# EasyEDA Pro project rp2040 control board.eprj, board PCB1
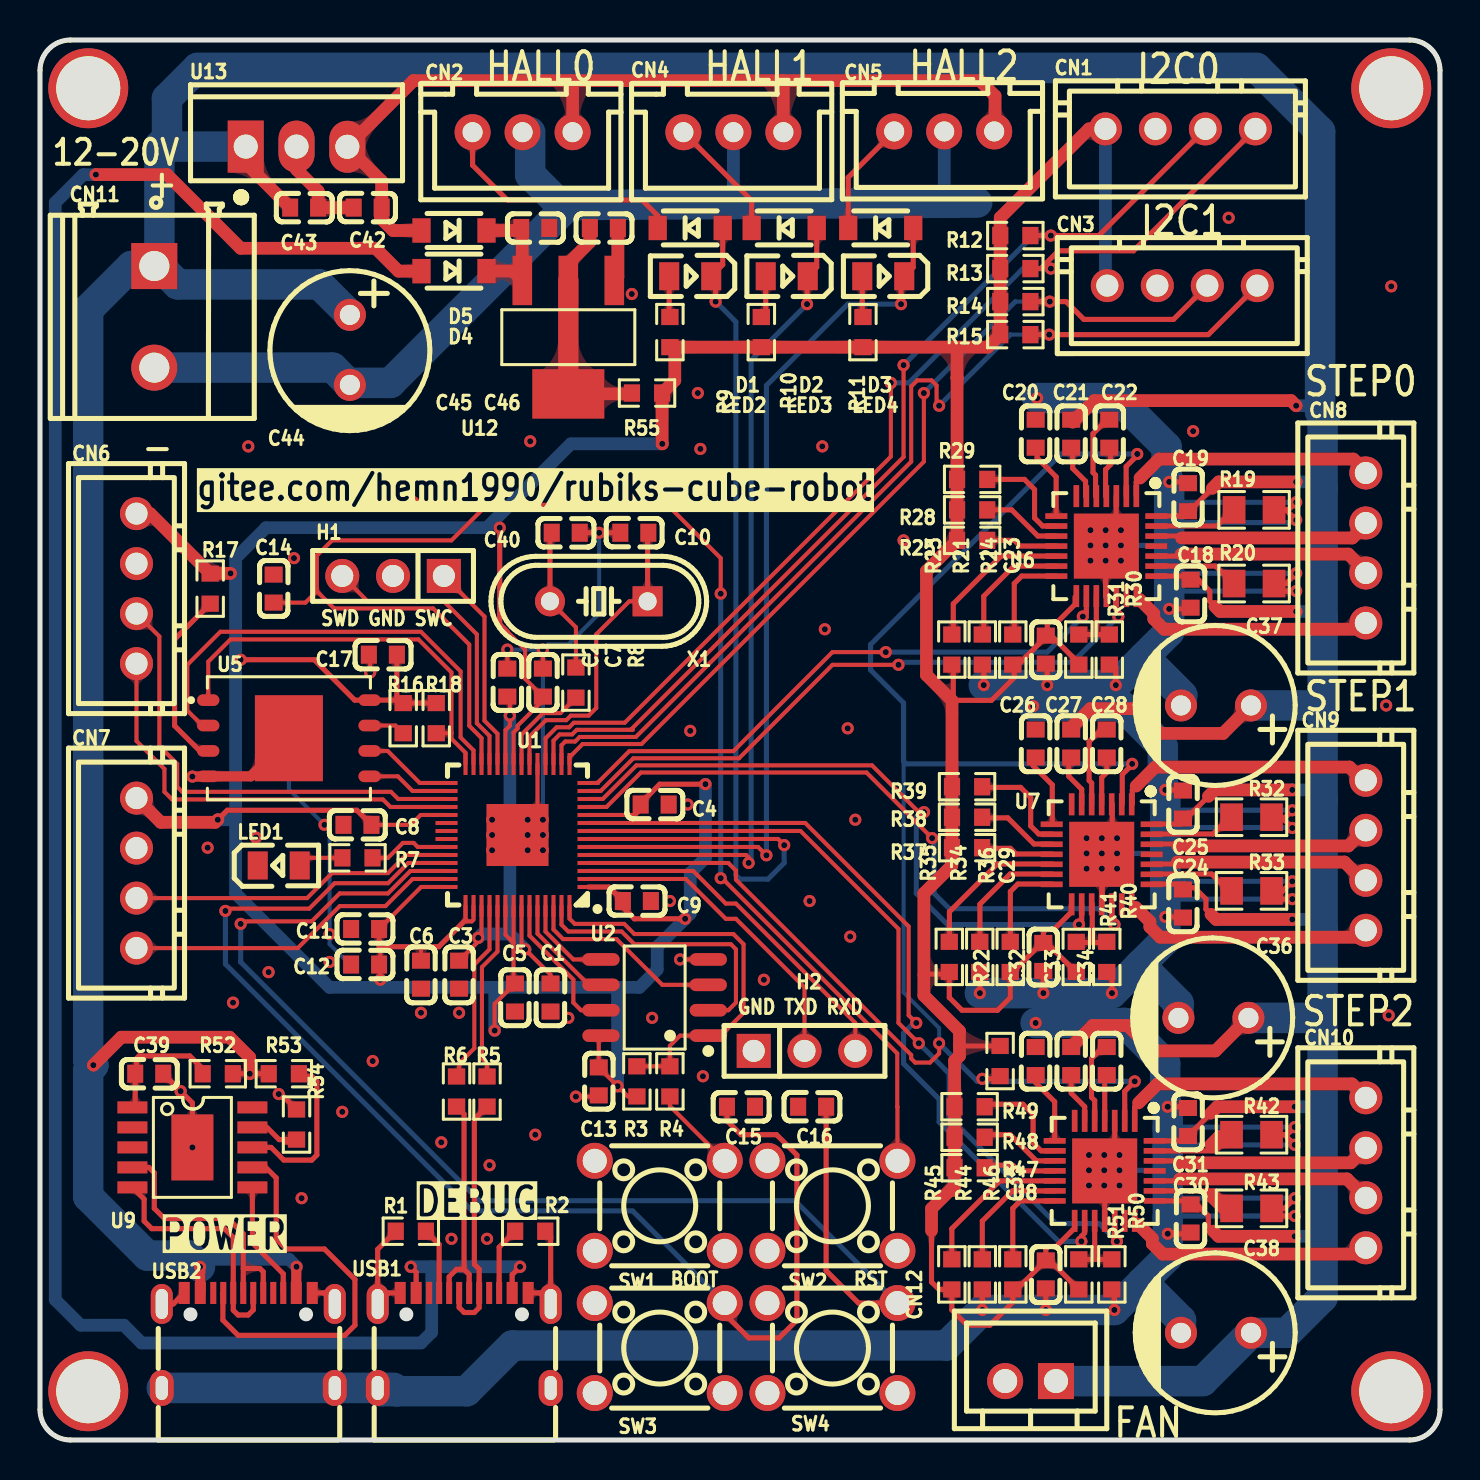
[diagram p1: board, top side]
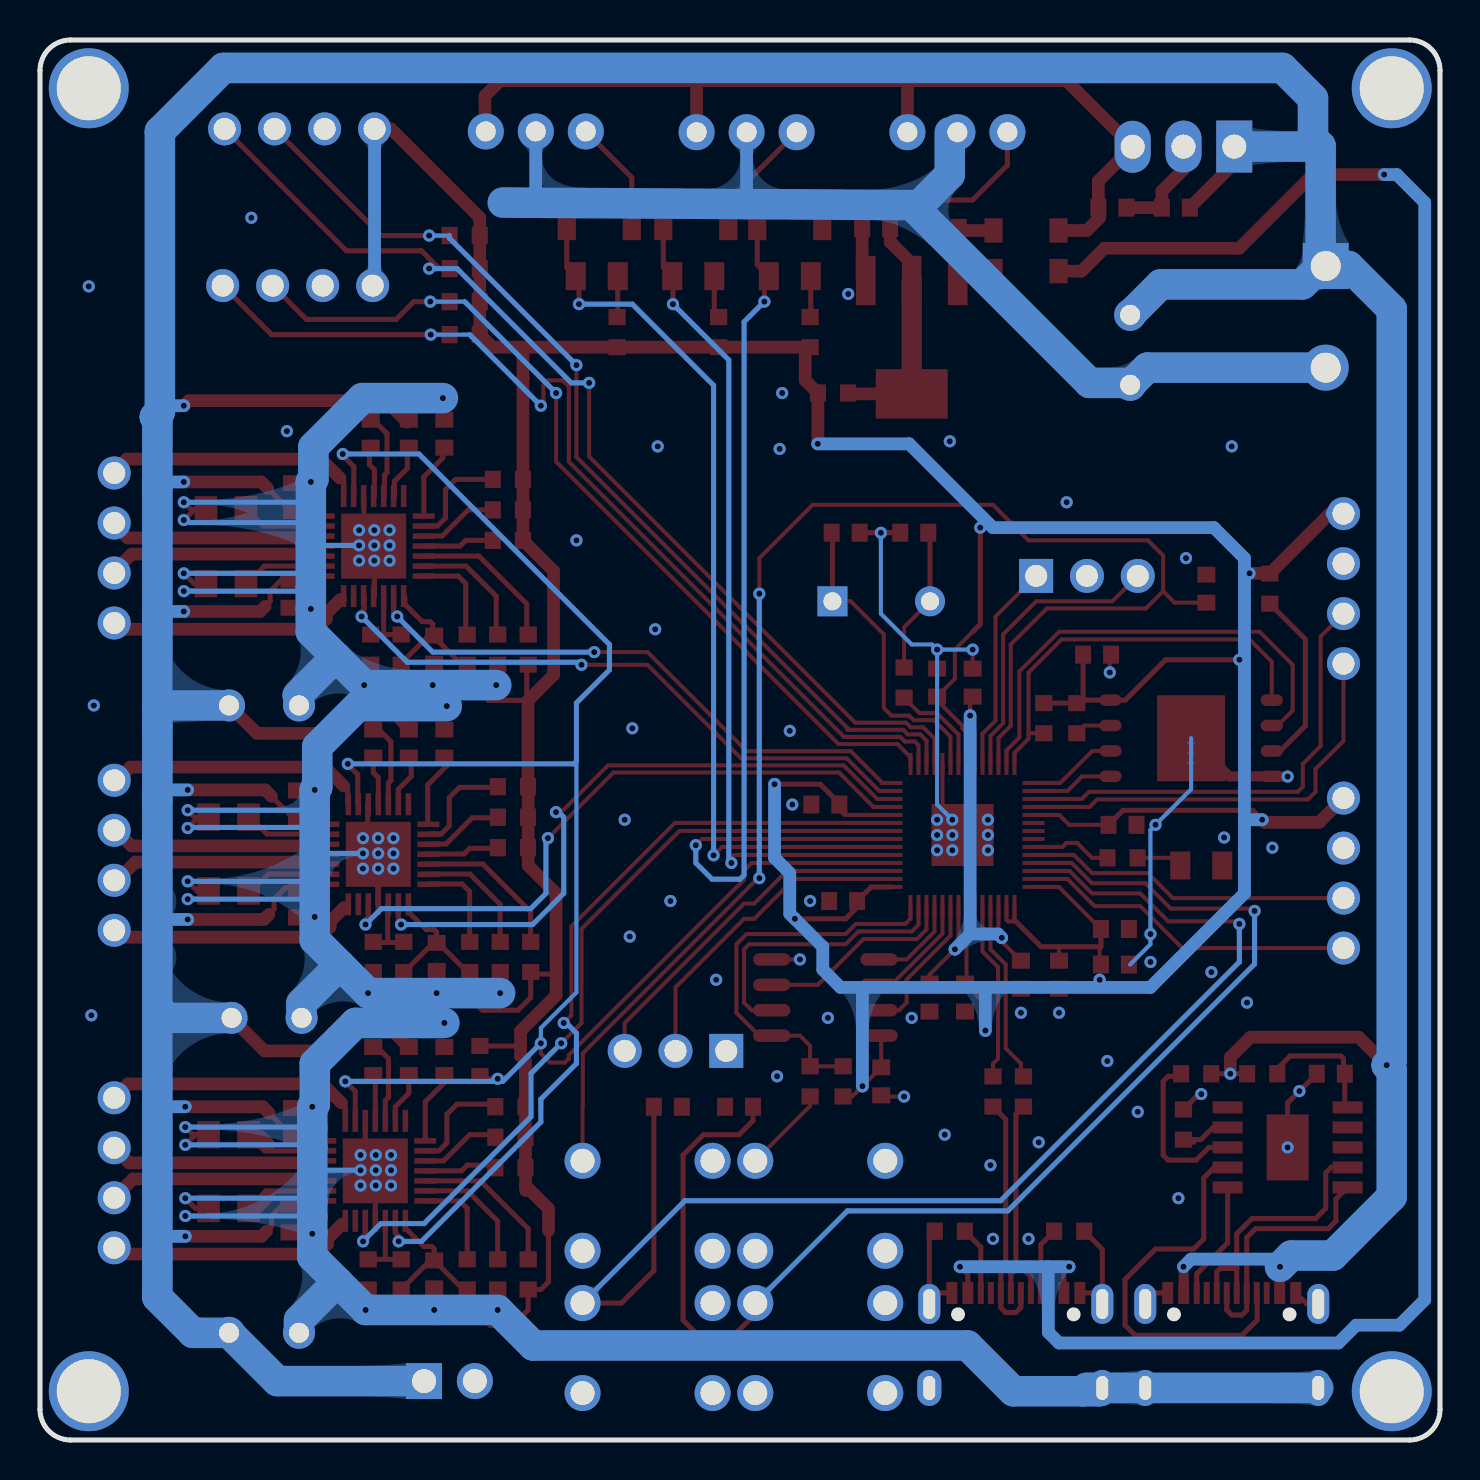
[diagram p2: board, bottom side, seen from below]

Outline 70 x 70 mm; copper layers: Top Layer, Bottom Layer. Coordinates in mm from the lower left corner of the outline.
Outline path: 0,68.48 0,1.52 arc(0.45,0.45) 1.52,0 68.48,0 arc(69.56,0.45) 70,1.52 70,68.48 arc(69.56,69.56) 68.48,70 1.52,70 arc(0.45,69.56) 0,68.48
Stack: Top Layer 0.035mm / Dielectric1 1.51mm FR4 er 4.5 / Bottom Layer 0.035mm

## Design rules (mm)
template: 自定义配置
spacing copperThickness1oz (default): track to track 0.152, other pairs 0.152 to 0.3
spacing copperThickness2oz: track to track 0.203, other pairs 0.152 to 0.3
track width copperThickness1oz (default): min 0.127, default 0.254, max 2.54
track width copperThickness2oz: min 0.203, default 0.254, max 2.54
differential pair differentialPair (default): width min 0.127, default 0.254, max 2.54; gap min 0.152, default 0.152
via viaSize (default): diameter min 0.5, default 0.61, max 10; hole min 0.3, default 0.305, max 6.299

## Placement (name value [footprint] x y rotation side)
C1  100nF  [C0603]  25.53 22.12 90 top
C2  100nF  [C0603]  23.37 37.87 270 top
C3  1uF  [C0603]  20.96 23.27 90 top
C4  100nF  [C0603]  30.73 31.78 180 top
C5  100nF  [C0603]  23.75 22.12 90 top
C6  100nF  [C0603]  19.05 23.27 90 top
C7  100nF  [C0603]  25.15 37.87 270 top
C8  100nF  [C0603]  15.88 30.76 0 top
C9  100nF  [C0603]  29.84 26.95 180 top
C10  27pF  [C0603]  29.72 45.36 0 top
C11  100nF  [C0603]  16.26 25.55 0 top
C12  1uF  [C0603]  16.26 23.77 0 top
C13  100nF  [C0603]  27.94 17.93 270 top
C14  100nF  [C0603]  11.68 42.57 270 top
C15  100nF  [C0603]  35.05 16.66 180 top
C16  100nF  [C0603]  38.61 16.66 0 top
C17  100nF  [C0603]  17.14 39.27 180 top
C18  100nF  [C0603]  57.53 42.32 90 top
C19  100nF  [C0603]  57.4 47.14 270 top
C20  220nF  [C0603]  49.78 50.32 90 top
C21  100nF  [C0603]  51.56 50.32 90 top
C22  100nF  [C0603]  53.47 50.32 90 top
C23  100nF  [C0603]  50.29 39.52 90 top
C24  100nF  [C0603]  57.15 26.82 90 top
C25  100nF  [C0603]  57.15 31.78 270 top
C26  220nF  [C0603]  49.78 34.82 90 top
C27  100nF  [C0603]  51.56 34.82 90 top
C28  100nF  [C0603]  53.34 34.82 90 top
C29  100nF  [C0603]  50.16 24.16 90 top
C30  100nF  [C0603]  57.53 11.07 90 top
C31  100nF  [C0603]  57.4 15.9 270 top
C32  220nF  [C0603]  49.78 18.95 90 top
C33  100nF  [C0603]  51.56 18.95 90 top
C34  100nF  [C0603]  53.34 18.95 90 top
C35  100nF  [C0603]  50.29 8.28 90 top
C36  330uF  [CAP-TH_BD8.0-P3.50-D0.6-FD]  58.67 21.11 180 top
C37  330uF  [CAP-TH_BD8.0-P3.50-D0.6-FD]  58.8 36.73 180 top
C38  330uF  [CAP-TH_BD8.0-P3.50-D0.6-FD]  58.8 5.36 180 top
C39  1uF  [C0603]  5.46 18.31 180 top
C40  27pF  [C0603]  26.29 45.36 180 top
C42  100nF  [C0603]  16.38 61.62 0 top
C43  100nF  [C0603]  13.21 61.62 180 top
C44  330uF  [CAP-TH_BD8.0-P3.50-D0.6-FD]  15.49 54.51 270 top
C45  10uF  [C0603]  24.76 60.6 180 top
C46  10uF  [C0603]  28.19 60.6 180 top
CN1  XH-4A  [CONN-TH_XH2.50-4P]  57.02 65.56 0 top
CN2  XH-3A  [CONN-TH_XH-3A]  24.13 65.39 180 top
CN3  XH-4A  [CONN-TH_XH2.50-4P]  57.12 57.72 0 top
CN4  XH-3A  [CONN-TH_XH-3A]  34.67 65.39 180 top
CN5  XH-3A  [CONN-TH_XH-3A]  45.21 65.43 180 top
CN6  XH-4A  [CONN-TH_XH2.50-4P]  4.83 42.57 270 top
CN7  XH-4A  [CONN-TH_XH2.50-4P]  4.83 28.35 270 top
CN8  XH-4A  [CONN-TH_XH2.50-4P]  66.29 44.6 270 top
CN9  XH-4A  [CONN-TH_XH2.50-4P]  66.29 29.24 270 top
CN10  XH-4A  [CONN-TH_XH2.50-4P]  66.29 13.36 270 top
CN11  DB128V-5.08-2P-GN-S  [CONN-TH_2P-P5.08_DIBO_DB128V-5.08]  5.72 56.16 270 top
CN12  A2501WV-2P  [CONN-TH_A2501WV-2P]  49.53 2.95 180 top
D1  1N5819W  [SOD-123_L2.7-W1.6-LS3.7-R-RD]  32.51 60.6 0 top
D2  1N5819W  [SOD-123_L2.7-W1.6-LS3.7-R-RD]  37.21 60.6 0 top
D3  1N5819W  [SOD-123_L2.7-W1.6-LS3.7-R-RD]  42.04 60.6 0 top
D4  1N5819W  [SOD-123_L2.7-W1.6-LS3.7-R-RD]  20.7 58.45 180 top
D5  1N5819W  [SOD-123_L2.7-W1.6-LS3.7-R-RD]  20.7 60.48 180 top
H1  PZ254V-11-03P  [HDR-TH_3P-P2.54-V-M]  17.65 43.21 180 top
H2  PZ254V-11-03P  [HDR-TH_3P-P2.54-V-M]  38.23 19.46 0 top
LED1  NCD0805R1  [LED0805-R-RD]  11.94 28.73 0 top
LED2  NCD0805R1  [LED0805-R-RD]  32.51 58.19 180 top
LED3  NCD0805R1  [LED0805-R-RD]  37.34 58.19 180 top
LED4  NCD0805R1  [LED0805-R-RD]  42.16 58.19 180 top
NOREF  -  [Pad_e147]  67.56 2.44 0 top
NOREF#2  -  [Pad_e152]  67.56 67.59 0 top
NOREF#3  -  [Pad_e265]  2.41 2.44 0 top
NOREF#4  -  [Pad_e262]  2.41 67.59 0 top
R1  5.1kΩ  [R0603]  18.54 10.44 0 top
R2  5.1kΩ  [R0603]  24.51 10.44 180 top
R3  10kΩ  [R0603]  29.84 17.93 270 top
R4  1k  [R0603]  31.5 17.93 90 top
R5  27Ω  [R0603]  22.35 17.42 270 top
R6  27Ω  [R0603]  20.83 17.42 270 top
R7  1k  [R0603]  15.88 29.11 180 top
R8  1k  [R0603]  26.8 37.87 270 top
R9  1k  [R0603]  31.5 55.4 90 top
R10  1k  [R0603]  36.07 55.4 90 top
R11  1k  [R0603]  41.15 55.4 90 top
R12  5.1kΩ  [R0603]  48.77 60.22 180 top
R13  5.1kΩ  [R0603]  48.77 58.57 180 top
R14  5.1kΩ  [R0603]  48.77 56.92 180 top
R15  5.1kΩ  [R0603]  48.77 55.27 180 top
R16  10kΩ  [R0603]  18.16 36.09 270 top
R17  10kΩ  [R0603]  8.51 42.57 90 top
R18  10kΩ  [R0603]  19.81 36.09 90 top
R19  100mΩ  [R0805]  60.71 46.51 0 top
R20  100mΩ  [R0805]  60.71 42.82 0 top
R21  0Ω  [R0603]  47.12 39.52 90 top
R22  10kΩ  [R0603]  48.01 18.95 270 top
R23  10kΩ  [R0603]  45.59 39.52 270 top
R24  10kΩ  [R0603]  48.64 39.52 270 top
R25  0Ω  [R0603]  46.61 44.98 0 top
R28  0Ω  [R0603]  46.61 46.51 0 top
R29  0Ω  [R0603]  46.61 48.03 0 top
R30  5.1kΩ  [R0603]  53.47 39.52 90 top
R31  8.2kΩ  [R0603]  51.94 39.52 270 top
R32  100mΩ  [R0805]  60.58 31.14 0 top
R33  100mΩ  [R0805]  60.58 27.46 0 top
R34  0Ω  [R0603]  46.99 24.16 90 top
R35  10kΩ  [R0603]  45.47 24.16 270 top
R36  10kΩ  [R0603]  48.51 24.16 270 top
R37  0Ω  [R0603]  46.35 29.62 0 top
R38  0Ω  [R0603]  46.35 31.14 0 top
R39  0Ω  [R0603]  46.35 32.66 0 top
R40  5.1kΩ  [R0603]  53.34 24.16 90 top
R41  8.2kΩ  [R0603]  51.82 24.16 270 top
R42  100mΩ  [R0805]  60.58 15.27 0 top
R43  100mΩ  [R0805]  60.58 11.58 0 top
R44  0Ω  [R0603]  47.12 8.28 90 top
R45  10kΩ  [R0603]  45.59 8.28 270 top
R46  10kΩ  [R0603]  48.64 8.28 270 top
R47  0Ω  [R0603]  46.48 13.61 0 top
R48  0Ω  [R0603]  46.48 15.14 0 top
R49  0Ω  [R0603]  46.48 16.66 0 top
R50  5.1kΩ  [R0603]  53.59 8.28 90 top
R51  8.2kΩ  [R0603]  51.94 8.28 270 top
R52  1k  [R0603]  8.89 18.31 0 top
R53  10kΩ  [R0603]  12.19 18.31 0 top
R54  56kΩ  [R0603]  12.83 15.77 270 top
R55  0Ω  [R0603]  30.35 52.35 0 top
SW1  TS665CJ  [SW-TH_4P-L6.0-W6.0-P4.50-LS6.5]  30.99 11.71 0 top
SW2  TS665CJ  [SW-TH_4P-L6.0-W6.0-P4.50-LS6.5]  39.62 11.71 0 top
SW3  TS665CJ  [SW-TH_4P-L6.0-W6.0-P4.50-LS6.5]  30.99 4.6 0 top
SW4  TS665CJ  [SW-TH_4P-L6.0-W6.0-P4.50-LS6.5]  39.62 4.6 0 top
U1  RP2040  [LQFN-56_L7.0-W7.0-P0.4-EP]  23.88 30.25 180 top
U2  W25Q16JVSNIQ  [SOP-8_L4.9-W3.9-P1.27-LS6.0-BL]  30.73 22.12 90 top
U5  W25N01GVZEIG  [WSON-8_L8.0-W6.10-P1.27-TL-EP]  12.45 35.09 0 top
U6  HR4988E  [QFN-28_L5.0-W5.0-P0.50-BL-EP3.3]  53.32 44.7 180 top
U7  HR4988E  [QFN-28_L5.0-W5.0-P0.50-BL-EP3.3]  53.09 29.29 180 top
U8  HR4988E  [QFN-28_L5.0-W5.0-P0.50-BL-EP3.3]  53.24 13.46 180 top
U9  CH224K  [ESSOP-10_L4.9-W3.9-P1.0-LS6.0-TL-EP]  7.62 14.63 270 top
U12  AMS1117-3.3  [SOT-223-4_L6.5-W3.5-P2.30-LS7.0-BR]  26.42 55.14 90 top
U13  L7805CV-DG  [TO-220-3_L10.0-W4.5-P2.54-L]  12.83 64.67 0 top
USB1  TYPE-C 16PIN 2MD(073)  [USB-C-SMD_TYPE-C-6PIN-2MD-073]  21.21 4.98 0 top
USB2  TYPE-C 16PIN 2MD(073)  [USB-C-SMD_TYPE-C-6PIN-2MD-073]  10.41 4.98 0 top
X1  12MHz  [HC-49US_L11.5-W4.5-P4.88]  27.94 41.94 180 top

## Footprints (pads in the part's own frame, mm; a bottom-side part is the same pattern mirrored in y, then rotated)
C0603
  rect 0.8x0.9 smd: 1(-0.7,0) 2(0.7,0)
CAP-TH_BD8.0-P3.50-D0.6-FD
  round 1.6 hole 1: 1(-1.75,0) 2(1.75,0)
CONN-TH_2P-P5.08_DIBO_DB128V-5.08
  rect 2.3x2.3 hole 1.5: 1(-2.54,0)
  round 2.3 hole 1.5: 2(2.54,0)
CONN-TH_A2501WV-2P
  rect 1.8x1.8 hole 1.2: 1(-1.27,0)
  round 1.8 hole 1.2: 2(1.27,0)
CONN-TH_XH2.50-4P
  round 1.65 hole 1.1: 1(-3.75,0) 2(-1.25,0) 3(1.25,0) 4(3.75,0)
CONN-TH_XH-3A
  round 1.8 hole 1: 1(-2.5,0) 2(0,0) 3(2.5,0)
ESSOP-10_L4.9-W3.9-P1.0-LS6.0-TL-EP
  rect 0.6x1.5 smd: 1(-2,-3) 2(-1,-3) 3(0,-3) 4(1,-3) 5(2,-3) 6(2,3) 7(1,3) 8(0,3) 9(-1,3) 10(-2,3)
  rect 3.3x2.1 smd: 11(0,0)
HC-49US_L11.5-W4.5-P4.88
  rect 1.5x1.5 hole 0.9: 1(-2.44,0)
  round 1.5 hole 0.9: 2(2.44,0)
HDR-TH_3P-P2.54-V-M
  rect 1.7x1.7 hole 1.1: 1(-2.54,0)
  round 1.7 hole 1.1: 2(0,0) 3(2.54,0)
LED0805-R-RD
  rect 1x1.399 smd: 1(1.05,0) 2(-1.05,0)
LQFN-56_L7.0-W7.0-P0.4-EP
  rect 1.1x0.2 smd: 1(-3.55,2.6) 2(-3.55,2.2) 3(-3.55,1.8) 4(-3.55,1.4) 5(-3.55,1) 6(-3.55,0.6) 7(-3.55,0.2) 8(-3.55,-0.2) 9(-3.55,-0.6) 10(-3.55,-1) 11(-3.55,-1.4) 12(-3.55,-1.8) 13(-3.55,-2.2) 14(-3.55,-2.6) 29(3.55,-2.6) 30(3.55,-2.2) 31(3.55,-1.8) 32(3.55,-1.4) 33(3.55,-1) 34(3.55,-0.6) 35(3.55,-0.2) 36(3.55,0.2) 37(3.55,0.6) 38(3.55,1) 39(3.55,1.4) 40(3.55,1.8) 41(3.55,2.2) 42(3.55,2.6)
  rect 0.2x1.1 smd: 15(-2.6,-3.55) 16(-2.2,-3.55) 17(-1.8,-3.55) 18(-1.4,-3.55) 19(-1,-3.55) 20(-0.6,-3.55) 21(-0.2,-3.55) 22(0.2,-3.55) 23(0.6,-3.55) 24(1,-3.55) 25(1.4,-3.55) 26(1.8,-3.55) 27(2.2,-3.55) 28(2.6,-3.55) 43(2.6,3.55) 44(2.2,3.55) 45(1.8,3.55) 46(1.4,3.55) 47(1,3.55) 48(0.6,3.55) 49(0.2,3.55) 50(-0.2,3.55) 51(-0.6,3.55) 52(-1,3.55) 53(-1.4,3.55) 54(-1.8,3.55) 55(-2.2,3.55) 56(-2.6,3.55)
  rect 3.1x3.1 smd: 57(0,0)
Pad_e147
  round 4 hole 3.2: 58(0,0)
Pad_e152
  round 4 hole 3.2: 58(0,0)
Pad_e262
  round 4 hole 3.2: 58(0,0)
Pad_e265
  round 4 hole 3.2: 58(0,0)
QFN-28_L5.0-W5.0-P0.50-BL-EP3.3
  rect 0.28x1.1 smd: 1(-1.501,-2.5) 2(-1.001,-2.5) 3(-0.5,-2.5) 4(0,-2.5) 5(0.5,-2.5) 6(1,-2.5) 7(1.501,-2.5) 15(1.501,2.5) 16(1,2.5) 17(0.5,2.5) 18(0,2.5) 19(-0.5,2.5) 20(-1.001,2.5) 21(-1.502,2.5)
  rect 1.1x0.28 smd: 8(2.5,-1.502) 9(2.5,-1.001) 10(2.5,-0.5) 11(2.5,0) 12(2.5,0.5) 13(2.5,1) 14(2.5,1.501) 22(-2.5,1.501) 23(-2.5,1) 24(-2.5,0.5) 25(-2.5,0) 26(-2.5,-0.5) 27(-2.5,-1.001) 28(-2.5,-1.502)
  rect 3.25x3.25 smd: 29(0,0)
R0603
  rect 0.806x0.864 smd: 1(-0.753,0) 2(0.753,0)
R0805
  rect 1.133x1.377 smd: 1(-1,0) 2(1,0)
SOD-123_L2.7-W1.6-LS3.7-R-RD
  rect 0.909x1.219 smd: 1(1.625,0) 2(-1.625,0)
SOP-8_L4.9-W3.9-P1.27-LS6.0-BL
  oval 0.63x1.865 smd: 1(-1.905,-2.683) 2(-0.635,-2.683) 3(0.635,-2.683) 4(1.905,-2.683) 5(1.905,2.683) 6(0.635,2.683) 7(-0.635,2.683) 8(-1.905,2.683)
SOT-223-4_L6.5-W3.5-P2.30-LS7.0-BR
  rect 2.47x0.98 smd: 1(2.835,-2.3) 2(2.835,0) 3(2.835,2.3)
  rect 2.47x3.6 smd: 4(-2.835,0)
SW-TH_4P-L6.0-W6.0-P4.50-LS6.5
  round 1.8 hole 1.2: 1(-3.25,2.25) 2(3.25,2.25) 3(-3.25,-2.25) 4(3.25,-2.25)
TO-220-3_L10.0-W4.5-P2.54-L
  rect 1.8x2.6 hole 1.2: 1(-2.54,0.005)
  oval 1.8x2.6 hole 1.2: 2(0,0.005) 3(2.54,-0.005)
USB-C-SMD_TYPE-C-6PIN-2MD-073
  rect 0.55x1.1 smd: 1(-3.2,2.375) 2(-2.4,2.375) 11(2.4,2.375) 12(3.2,2.375)
  rect 0.3x1.1 smd: 3(-1.75,2.375) 4(-1.25,2.375) 5(-0.75,2.375) 6(-0.25,2.375) 7(0.25,2.375) 8(0.75,2.375) 9(1.25,2.375) 10(1.75,2.375)
  oval 1.1x2 hole 0.6x1.5: 13(-4.325,1.825) 14(4.325,1.825)
  oval 1.2x1.8 hole 0.6x1.2: 13(-4.325,-2.375) 14(4.325,-2.375)
WSON-8_L8.0-W6.10-P1.27-TL-EP
  oval 1.115x0.581 smd: 1(-4.033,1.905) 2(-4.033,0.635) 3(-4.033,-0.635) 4(-4.033,-1.905) 5(4.033,-1.905) 6(4.033,-0.635) 7(4.033,0.635) 8(4.033,1.905)
  rect 3.4x4.3 smd: 9(0,0)

## Nets
As in the schematic, except:
GND: C1.1 C2.1 C3.1 C4.1 C5.1 C6.1 C7.1 C8.1 C9.1 C10.1 C11.1 C12.1 C13.2 C14.1 C15.1 C16.1 C17.2 C18.1 C19.1 C20.2 C23.1 C24.1 C25.1 C26.2 C29.1 C30.1 C31.1 C32.2 C35.1 C36.2 C37.2 C38.2 C39.1 C40.1 C42.1 C43.1 C44.2 C45.1 C46.1 CN1.2 CN2.2 CN3.2 CN4.2 CN5.2 CN6.2 CN7.2 CN11.2 CN12.2 H1.2 H2.1 LED1.2 NOREF.58 NOREF#2.58 NOREF#3.58 NOREF#4.58 R1.1 R2.1 R19.2 R20.2 R21.1 R30.1 R32.2 R33.2 R34.1 R40.1 R42.2 R43.2 R44.1 R50.1 R54.1 SW1.3 SW2.3 SW3.3 SW4.3 U1.19 U1.57 U2.4 U5.4 U5.9 U6.3 U6.18 U6.29 U7.3 U7.18 U7.29 U8.3 U8.18 U8.29 U9.11 U12.1 U13.2 USB1.1 USB1.12 USB1.13 USB1.14 USB2.1 USB2.12 USB2.13 USB2.14

Pads without a net: SW1 1 4; SW2 1 4; SW3 1 4; SW4 1 4; U1 34 35 36; U6 7 20 25; U7 7 20 25; U8 7 20 25; U9 2 3 10; USB1 3 9; USB2 3 9

## Via types
v1: diameter 0.61, hole 0.305, Top Layer to Bottom Layer, 181 vias

## Routing (per net, layer and track width the routed paths; a pad name or vN(x,y) marks a point on that pad's centre or on a via; arc(x,y) is an arc through that point)
5V: length 47.7
  Top Layer w0.635: 26.55,67.97 37.13,67.97 ; 26.55,67.97 26.63,67.89 CN2.1 ; 26.55,67.97 18.67,67.97 U13.3 17.08,62.95 C42.2 17.02,61.56 17.02,61.11 17.65,60.48 D5.1 ; 37.13,67.97 37.17,67.93 CN4.1 ; 37.13,67.97 46.99,67.97 47.75,67.21 47.75,65.47 CN5.1
5V_USB: length 107.3
  Top Layer w0.254: v1(24,8.66) 23.61,8.27 USB1.11 ; USB1.2 18.81,8.39 v1(18.54,8.66)
  Top Layer w0.635: D4.1 17.92,58.45 16.78,59.59 10.03,59.59 6.35,63.27 v1(2.79,63.27)
  Bottom Layer w0.635: v1(2.79,63.27) 2.16,63.27 0.76,61.87 0.76,7.01 2.03,5.74 4.19,5.74 5.08,4.85 19.05,4.85 19.59,5.39 19.59,8.66 ; 19.59,8.66 v1(24,8.66) ; 19.59,8.66 v1(18.54,8.66)
GND: length 400.4
  Top Layer w0.203: v1(26.8,17.17) 27.88,17.17 C13.2 ; C2.1 v1(23.37,39.52) ; 24.88,33.8 24.88,30.74 v1(24.38,30.25) ; 11.45,34.09 U5.9 ; C7.1 v1(25.15,39.52) ; v1(16.51,38.38) 16.51,39.2 C17.2 ; U2.4 v1(32,24.03)
  Top Layer w0.254: v1(62.74,14.76) 62.23,15.27 ; 62.23,15.27 R42.2 ; 62.23,15.27 62.36,15.27 v1(62.74,15.65) ; v1(62.74,11.2) 61.96,11.2 R43.2 62.23,11.58 v1(62.74,12.09) ; USB2.14 14.19,7.35 USB2.12 ; 53.81,47.2 53.81,45.2 53.31,44.7 53.28,42.2 ; v1(56.27,32.51) 57.22,32.51 57.28,32.44 ; U8.3 53.74,13.96 53.24,13.46 U8.18 ; C31.1 57.34,16.66 v1(56.39,16.66) ; 62.11,31.11 61.46,31.11 ; 62.11,31.11 62.24,31.11 v1(62.62,31.49) ; 62.11,31.11 v1(62.62,30.6) ; U7.18 U7.29 ; v1(62.81,46) 62.3,46.51 ; 62.3,46.51 62.43,46.51 v1(62.81,46.89) ; 62.3,46.51 61.65,46.51 ; v1(53.6,22.35) 53.6,23.24 53.47,23.37 ; v1(56.46,41.56) 57.54,41.56 57.6,41.62 ; v1(62.62,27.04) 61.84,27.04 61.46,27.43 62.11,27.43 v1(62.62,27.93) ; v1(53.79,37.75) 53.79,38.64 53.67,38.77 ; 53.28,42.2 53.28,44.69 ; 53.28,42.2 53.28,42.19 ; USB2.1 6.66,6.8 USB2.13 ; v1(53.72,6.5) 53.72,7.4 R50.1 ; 53.62,31.8 53.62,29.8 53.12,29.3 53.12,26.8 ; v1(7.62,14.63) 7.62,16.85 v1(7.03,17.44) C39.1 ; R54.1 12.06,17.3 v1(11.94,17.3) ; C40.1 C10.1 ; C30.1 57.47,10.31 v1(56.39,10.31) ; v1(50.17,22.35) 50.17,23.42 ; v1(56.46,47.91) 57.29,47.91 ; v1(62.81,43.33) 62.3,42.83 61.65,42.83 62.03,42.44 v1(62.81,42.44) ; v1(50.29,6.5) C35.1 ; v1(47,22.35) 47,23.37 ; R2.1 25.53,10.17 USB1.14 24.98,7.35 USB1.12 ; 57.41,26.22 57.35,26.16 v1(56.27,26.16) ; R1.1 16.88,9.53 USB1.13 17.43,7.35 18.01,7.35 ; v1(47.12,6.5) R44.1 ; v1(50.37,37.75) 50.37,38.82 ; v1(47.19,37.75) 47.19,38.77 ; 57.41,47.91 57.48,47.84
  Top Layer w0.508: v1(7.62,33.17) 8.4,33.17 U5.4 10.54,33.18 11.45,34.09
  Top Layer w0.635: 12.83,64.67 12.83,63.53 13.91,62.44 C43.1 C42.1 ; U12.1 28.89,58.16 C46.1
  Bottom Layer w0.203: 15.49,23.77 14.48,24.79 v1(14.48,25.3) 14.48,30.51 v1(14.22,30.76) 12.45,32.54 U5.9 ; v1(25.15,39.52) v1(23.37,39.52) ; v1(25.15,39.52) 25.15,31.78 v1(24.38,31.01) ; v1(25.15,39.52) 25.4,39.78 26.42,39.78 27.96,41.32 v1(27.96,45.36)
  Bottom Layer w0.254: 56.46,44.81 56.38,44.73 v1(54.05,44.73) ; 56.39,14.66 56.49,14.76 v1(62.74,14.76) ; 56.39,26.95 56.48,27.04 v1(62.62,27.04) ; 56.64,45.87 62.68,45.87 v1(62.81,46) ; v1(62.62,27.93) 56.13,27.93 ; 56.64,11.96 56.77,12.09 v1(62.74,12.09) ; v1(62.81,43.33) 62.81,43.34 56.46,43.34 ; 56.39,11.12 56.47,11.2 v1(62.74,11.2) ; 56.27,31.34 56.41,31.49 v1(62.62,31.49) ; 56.27,29.43 56.17,29.33 v1(53.85,29.33) ; 56.39,13.34 56.24,13.49 v1(53.97,13.49) ; v1(62.74,15.65) 56.43,15.65 56.39,15.6 ; 56.46,42.6 56.62,42.44 v1(62.81,42.44) ; 56.27,30.63 62.59,30.63 v1(62.62,30.6) ; v1(62.81,46.89) 56.64,46.89
  Bottom Layer w0.635: CN4.2 34.67,61.37 ; 44.83,62 45.21,62.38 CN5.2
  Bottom Layer w1.524: USB1.13 USB2.14 USB2.13 ; USB1.13 17.68,2.6 17.85,2.44 ; USB1.13 17.05,2.44 17.85,2.44 ; 46.86,61.87 34.67,61.8 26.42,61.75 17.53,52.86 15.59,52.86 C44.2 14.63,53.62 5.97,53.62 ; v1(49.66,36.7) 54.11,36.7 56.14,34.66 56.14,32.63 v1(56.27,32.51) v1(56.27,26.16) 56.27,25.01 55.01,23.76 ; 17.85,2.44 21.34,2.44 23.62,4.72 45.34,4.72 v1(47.12,6.5) v1(50.29,6.5) v1(53.72,6.5) 55.13,7.91 ; v1(49.78,20.85) 54.23,20.85 56.26,18.82 56.26,16.79 v1(56.39,16.66) v1(56.39,10.31) 56.39,9.17 55.13,7.91 ; 55.2,39.16 56.46,40.41 v1(56.46,41.56) v1(56.46,47.91) 56.33,48.03 56.33,49.65 53.88,52.1 v1(49.86,52.1) ; 55.2,39.16 57.12,37.24 ; 55.2,39.16 v1(53.79,37.75) v1(50.37,37.75) v1(47.19,37.75) ; v1(47,22.35) v1(50.17,22.35) v1(53.6,22.35) 55.01,23.76 ; 55.01,23.76 56.93,21.84 56.93,21.2 ; 55.13,7.91 57.05,5.99 C38.2 ; 24.51,65.39 24.51,63.27 26.03,61.75
  vias: v1(8.38,29.62) v1(9.65,21.87) v1(10.41,49.68) v1(10.8,30.12) v1(11.43,23.39) v1(12.7,44.09) v1(13.08,12.09) v1(14.48,23.9) v1(15.11,16.41) v1(16.64,18.95) v1(18.67,46.89) v1(19.05,21.36) v1(20.07,14.88) v1(20.57,10.06) v1(20.96,21.36) v1(22.35,10.06) v1(22.48,13.74) v1(22.61,31.01) v1(22.61,30.25) v1(22.61,29.49) v1(24.38,29.49) v1(24.51,49.94) v1(24.76,15.27) v1(25.15,31.01) v1(25.15,30.25) v1(25.15,29.49) v1(26.42,21.11) v1(29.59,57.3) v1(30.61,21.11) v1(31.5,26.95) v1(32.38,31.78) v1(32.51,35.46) v1(32.89,52.35) v1(33.02,49.56) v1(33.15,18.19) v1(36.19,23.01) v1(38.48,26.95) v1(39.12,49.68) v1(39.24,40.54) v1(40.39,35.59) v1(40.51,25.17) v1(40.77,31.01) v1(43.18,44.98) v1(52.33,30.09) v1(52.33,29.33) v1(52.33,28.57) v1(52.52,45.49) v1(52.52,44.73) v1(52.52,43.97) v1(52.45,14.25) v1(52.45,13.49) v1(52.45,12.73) v1(53.09,30.09) v1(53.09,29.33) v1(53.09,28.57) v1(53.21,14.25) v1(53.21,13.49) v1(53.21,12.73) v1(53.29,45.49) v1(53.29,44.73) v1(53.29,43.97) v1(53.85,30.09) v1(53.85,28.57) v1(54.05,45.49) v1(54.05,43.97) v1(53.97,14.25) v1(53.97,12.73) v1(57.66,50.44) v1(59.44,61.11) v1(67.31,36.73) v1(67.44,21.23) v1(67.56,57.68)
VIN: length 333.5
  Top Layer w0.254: 55.62,30.8 57.04,30.8 58.42,32.19 ; 58.75,41.68 58.49,41.94 58.49,42.44 57.92,43.02 57.6,43.02 57.42,43.2 55.81,43.2 ; 58.67,10.44 58.42,10.69 58.42,11.2 57.85,11.77 C30.2 57.35,11.96 U8.22 ; 58.62,47.58 57.24,46.2 55.81,46.2 ; R52.2 v1(10.49,18.31) R53.1 ; 58.55,26.28 58.3,26.54 58.3,27.04 57.73,27.62 57.41,27.62 57.23,27.8 55.62,27.8 ; 58.54,16.34 C31.2 57.16,14.96 U8.28
  Top Layer w0.508: USB2.2 8.01,8.65 v1(8,8.66) ; USB2.11 12.81,8.52
  Top Layer w0.635: C36.1 58.77,19.46 55.65,19.46 54.38,20.73 52.64,20.73 C33.2 ; 51.44,35.49 52.52,36.57 54.77,36.57 56.01,35.33 59.15,35.33 C37.1 ; v1(2.67,18.74) 4.06,20.14 9.48,20.14 10.49,19.13 v1(10.49,18.31) ; C43.2 10.29,63.84 10.29,64.67 ; v1(62.62,32.51) 58.75,32.51 58.42,32.19 ; 58.75,41.68 59,41.43 v1(62.81,41.43) ; v1(62.81,47.91) 58.94,47.91 58.62,47.58 ; v1(62.62,26.03) 58.81,26.03 58.55,26.28 ; v1(62.74,10.19) 58.93,10.19 58.67,10.44 ; 58.54,16.34 58.87,16.66 v1(62.74,16.66) ; 51.63,50.89 52.71,51.97 62.56,51.97 v1(62.81,51.72)
  Bottom Layer w0.635: 64.01,51.41 63.7,51.72 v1(62.81,51.72) ; 64.26,51.16 64.34,51.08 ; 64.46,40.92 64.33,40.92 63.82,41.43 v1(62.81,41.43) ; v1(62.81,47.91) 63.82,47.91 64.13,47.59 ; v1(62.74,10.19) 64.01,10.19 ; v1(62.62,26.03) 63.63,26.03 64.13,25.52 64.27,25.52 ; v1(12.83,8.66) 12.45,9.04 8.38,9.04 v1(8,8.66) ; v1(62.74,16.66) 63.88,16.66 ; 64.13,35.69 64.14,35.68 ; v1(62.62,32.51) 63.63,32.51 64.13,32 64.14,32
  Bottom Layer w1.524: 5.97,58.7 5.97,64.7 6.35,65.08 6.35,67.08 7.87,68.61 60.83,68.61 64.01,65.43 64.01,51.41 64.26,51.16 64.13,51.03 64.13,36.56 ; 5.97,58.7 6.89,57.78 13.97,57.78 C44.1 ; 5.97,58.7 4.57,58.7 2.41,56.54 2.41,19 v1(2.67,18.74) 2.41,18.49 2.41,12.17 5.36,9.22 7.44,9.22 v1(8,8.66) ; 64.13,36.56 63.97,36.73 C37.1 ; 64.13,36.56 64.13,7.14 62.36,5.36 C38.1 58.14,2.95 CN12.1 ; C36.1 63.63,21.11 64.01,21.49 ; 10.29,64.67 6.35,64.67
1P1V: length 24.7
  Top Layer w0.203: 23.28,33.8 23.28,35.49 23.5,35.71 v1(23.5,36.22) 23.5,36.92 23.37,37.04 ; C1.2 25.53,23.27 v1(24.26,24.54) 24.08,24.72 U1.50 ; U1.45 22.08,25.28 v1(21.91,25.11) 21.91,24.92 C3.2
  Bottom Layer w0.635: v1(23.5,36.22) 23.5,25.3 ; 23.5,25.3 v1(24.26,24.54) ; 23.5,25.3 22.1,25.3 v1(21.91,25.11)
3P3V: length 309.3
  Top Layer w0.203: 23.68,33.8 23.68,35.38 23.88,35.58 23.88,35.72 25.15,36.98 C7.2 24.26,38.06 24.26,39.52 23.36,40.42 ; U1.42 19.06,27.65 C11.2 ; U1.33 19.03,31.25 18.54,30.76 C8.2 ; U1.48 23.28,25.26 23.68,24.86 ; 30.29,31.78 29.76,31.25 U1.10 ; U2.8 27.94,20.11 C13.1 v1(28.88,17.69) 29.39,17.18 R3.2 ; v1(17.02,23.01) 17.02,24.6 16.96,24.66 ; C6.2 19.05,24.65 19.07,24.66 ; U1.43 21.28,26 21.34,25.93 21.59,25.93 21.68,26.02 U1.44 ; 23.68,24.86 U1.49 ; 23.68,24.86 23.68,22.9 C5.2 22.73,21.81 v1(22.73,20.47)
  Top Layer w0.254: 50.37,24.82 50.17,24.82 50.17,25.02 ; 50.37,24.82 50.17,25.02 ; 50.37,24.82 51.82,23.37 ; 45.72,13.73 45.73,13.74 ; 50.29,9.18 50.29,9.55 50.42,9.68 50.81,9.68 51.74,10.6 U8.15 ; 50.29,9.18 50.49,8.98 ; 50.29,9.18 C35.2 ; v1(8.89,31.01) 9.37,31.49 15.85,31.49 C8.2 ; C35.2 48.84,7.53 R46.2 48.64,6.88 47.5,5.74 46.35,5.74 45.59,6.5 R45.2 44.95,7.53 44.58,7.9 44.58,10.47 ; C35.2 50.49,8.98 ; 18.01,36.99 U5.8 15.74,36.99 13.72,39.01 v1(10.03,39.01) ; 18.01,36.99 R16.1 R18.2 ; 18.01,36.99 17.84,37.16 C17.1 ; 50.17,25.02 50.17,25.39 50.3,25.52 50.69,25.52 51.56,26.39 51.56,26.75 ; v1(33.27,32.79) 30.99,32.79 29.97,31.78 29.97,31.46 ; 45.86,53.11 45.72,53.11 ; 50.49,8.98 R51.2 ; 50.37,40.42 50.37,40.22 ; 50.37,40.42 50.56,40.22 ; 50.37,40.42 50.37,40.79 50.49,40.92 50.89,40.92 51.76,41.79 51.76,42.15 ; 50.37,40.22 50.56,40.22 ; 50.37,40.22 48.91,38.77 48.71,38.77 48.71,38.13 47.57,36.98 45.69,36.98 45.67,37.01 45.67,38.77 ; C11.2 16.96,24.66 19.94,24.66 21.28,26 ; 50.56,40.22 52.02,38.77 ; R35.2 45.47,23.3 ; 45.47,23.3 44.24,23.3 44.2,23.26 ; 45.47,23.3 45.47,22.12 46.1,21.49 47.88,21.49 48.51,22.12 48.51,23.28 ; U1.1 28.44,27.65 C9.2 29.15,26.63 29.72,26.06 v1(32.26,26.06) ; 48.51,23.28 R36.2 ; 48.51,23.28 50.09,24.86 50.16,24.86 ; 48.13,19.7 45.97,19.7 ; 23.36,40.42 22.99,40.79 v1(22.99,45.62)
  Top Layer w0.635: 45.72,12.71 45.72,13.74 ; 45.72,12.71 44.58,11.57 44.58,10.47 ; 45.72,12.71 45.72,12.47 ; 45.86,53.1 45.85,53.11 ; 45.86,53.1 45.86,54.46 45.67,54.64 ; 45.86,53.1 R29.1 R28.1 R25.1 44.32,43.45 44.32,38.25 45.6,36.97 R39.1 45.59,32.66 45.59,28.73 44.2,27.33 44.2,22.23 45.97,20.45 45.97,19.2 45.73,18.96 45.73,16.66 R49.1 R48.1 45.73,13.74 ; CN6.1 5.51,46.32 R17.2 8.52,43.33 v1(9.53,43.33) ; 45.67,54.64 R11.1 R10.1 R9.1 31.74,54.4 31.74,52.98 R55.2 31.11,49.82 v1(31.12,49.81) ; 45.67,54.64 47.39,54.64 R15.2 R14.2 R13.2 R12.2 48.01,61.12 52.45,65.56 CN1.1 ; CN7.1 6.04,30.89 8.76,30.89 v1(8.89,31.01)
  Bottom Layer w0.635: 28.84,22.63 28.88,22.59 v1(28.88,17.69) ; 28.84,22.63 29.97,22.63 30.86,23.52 30.86,24.66 v1(32.26,26.06) 32.51,26.31 32.51,28.35 33.27,29.11 v1(33.27,32.79) ; 28.84,22.63 14.48,22.63 9.78,27.33 9.78,31.04 ; CN6.1 5.39,46.32 ; 9.78,31.04 9.78,44.09 11.3,45.62 22.35,45.62 26.54,49.81 v1(31.12,49.81) ; 9.78,31.04 9.75,31.01 v1(8.89,31.01) ; v1(22.73,20.47) 22.73,22.38 ; CN1.1 53.27,57.82 CN3.1
BUTTON_0_GP27: length 64.8
  Top Layer w0.203: U1.39 18.41,28.85 17.4,27.84 14.73,27.84 13.46,26.57 9.27,26.57
  Top Layer w0.254: SW3.2 34.24,6.3 35.43,5.11 36.96,5.11 37.85,5.99 37.85,14.25 36.83,15.27 35.05,15.27 34.35,15.97 C15.2
  Bottom Layer w0.254: SW3.2 29.63,11.46 21.61,11.46 9.27,23.8 v1(9.27,26.45)
BUTTON_1_GP28: length 65.7
  Top Layer w0.203: 9.91,25.93 13.59,25.93 14.99,27.33 17.4,27.33 18.52,28.45 U1.40
  Top Layer w0.254: SW4.2 40.93,6.85 39.31,8.47 C16.2
  Bottom Layer w0.254: SW4.2 37.76,11.96 21.97,11.96 10.03,23.9 v1(10.03,25.81)
CC1: length 20
  Top Layer w0.254: U9.7 11.29,13.63 11.81,13.11 11.81,10.06 12.32,9.55 14.22,9.55 15.75,8.03 15.75,5.74 15.24,5.23 9.91,5.23 9.14,5.99 9.14,7.33 USB2.4
CC2: length 5.9
  Top Layer w0.254: USB2.10 12.16,8.31 10.62,9.85 U9.6
CLK_GP18: length 4.5
  Top Layer w0.203: U5.6 17.39,34.45 18.99,32.85 U1.29
CS: length 20.3
  Top Layer w0.203: R3.1 R4.2 31.5,19.71 32,20.22 U2.1 34.04,20.22 35.18,21.36 35.18,24.79 34.67,25.3 29.72,25.3 29.21,25.81 26.74,25.81 26.48,26.07 U1.56
CS_GP17: length 20.9
  Top Layer w0.203: 21.28,33.8 21.28,34.36 20.57,35.06 20.57,35.36 ; U5.1 8.41,38.92 9.53,40.03 18.92,40.03 20.57,38.38 20.57,35.36 ; 20.57,35.36 20.56,35.34 R18.1
DI_GP19: length 4.2
  Top Layer w0.203: U5.5 17.89,33.18 18.63,32.45 U1.30
DM: length 12.4
  Top Layer w0.254: U9.5 5.21,12.04 5.21,10.95 5.59,10.57 9.22,10.57 9.66,10.13 USB2.5 9.66,6.49 9.91,6.25 10.41,6.25 10.66,6.5 USB2.7
DO_GP16: length 23.7
  Top Layer w0.203: 21.68,33.8 21.68,34.48 21.03,35.13 21.03,38.43 19.05,40.41 9.02,40.41 7.37,38.76 7.37,36.47 8.12,35.72 U5.2
DP: length 13
  Top Layer w0.254: USB2.8 11.16,8.41 10.99,8.58 10.16,8.58 ; U9.4 5.44,13.63 5.72,13.36 5.72,11.58 6.22,11.07 9.4,11.07 10.16,10.31 10.16,8.58 ; 10.16,8.58 USB2.6
GP20: length 23.2
  Top Layer w0.203: U1.31 17.91,32.05 17.55,32.41 7.11,32.41 6.86,32.66 6.86,33.81 5.97,34.7 5.97,40.18 CN6.3
GP21: length 21.4
  Top Layer w0.203: U1.32 17.52,31.65 17.14,32.03 6.6,32.03 6.22,32.41 6.22,33.55 4.83,34.95 CN6.4
GP26: length 16.4
  Top Layer w0.203: U1.38 18.3,29.25 17.4,28.35 14.61,28.35 13.36,27.1 CN7.3
GP29: length 16.9
  Top Layer w0.203: U1.41 18.63,28.05 17.27,26.7 14.99,26.7 12.89,24.6 CN7.4
HALL_0_GP5: length 46.7
  Top Layer w0.203: v1(37.21,29.74) 36.9,30.05 U1.7
  Top Layer w0.254: D1.1 34.14,58.77 LED2.2 33.78,57.97 v1(33.78,56.92)
  Bottom Layer w0.254: v1(37.21,29.74) 37.21,28.85 36.4,28.04 35,28.04 34.8,28.24 34.8,55.91 v1(33.78,56.92)
HALL_1_GP3: length 41.5
  Top Layer w0.203: v1(35.43,28.85) 35.43,29.12 35.31,29.25 U1.5
  Top Layer w0.254: D2.1 38.84,58.64 LED3.2 38.35,58.16 v1(38.35,56.79)
  Bottom Layer w0.254: v1(38.35,56.79) 35.56,54 35.56,28.98 v1(35.43,28.85)
HALL_2_GP4: length 45
  Top Layer w0.203: U1.6 35.91,29.65 v1(36.32,29.24)
  Top Layer w0.254: D3.1 43.66,58.64 LED4.2 43.05,58.03 v1(43.05,56.79)
  Bottom Layer w0.254: v1(36.32,29.24) 36.32,52.73 40.39,56.79 v1(43.05,56.79)
IO0: length 4.6
  Top Layer w0.203: U1.53 25.28,25.42 26.67,24.03 U2.5
IO1: length 14.4
  Top Layer w0.203: U1.55 26.08,25.77 26.42,25.43 29.08,25.43 29.72,24.79 34.54,24.79 34.8,24.54 34.8,21.87 34.42,21.49 U2.2
IO2: length 10.1
  Top Layer w0.203: U1.54 25.68,25.53 26.16,25.04 28.83,25.04 31.12,22.76 U2.3
IO3: length 7.3
  Top Layer w0.203: U2.7 27.05,21.49 26.67,21.87 26.67,23.02 24.48,25.22 U1.51
SCK: length 5.6
  Top Layer w0.203: U2.6 27.44,22.76 24.88,25.32 U1.52
SCL0_GP15: length 52.6
  Top Layer w0.203: 25.28,33.8 25.28,35.08 25.83,35.64 26.46,35.64 26.69,35.86 29.24,35.86 42.54,49.17 v1(42.54,52.86)
  Top Layer w0.254: CN1.4 54.68,59.46 50.93,59.46 50.04,58.57 R13.1
  Bottom Layer w0.254: v1(42.54,52.86) 43.43,52.86 49.15,58.57 v1(50.55,58.57)
SCL1_GP13: length 50
  Top Layer w0.203: 26.08,33.8 26.08,34.74 26.26,34.92 26.76,34.92 26.99,35.15 29.79,35.15 43.56,48.92 43.56,52.68 43.87,52.98 44.58,52.98 44.83,52.73 44.83,51.84 v1(44.96,51.71)
  Top Layer w0.254: R15.1 v1(50.46,55.27) 58.42,55.27 CN3.4
  Bottom Layer w0.203: 48.51,55.27 v1(50.46,55.27)
  Bottom Layer w0.254: v1(44.96,51.71) 48.51,55.27
SDA0_GP14: length 50.3
  Top Layer w0.203: 29.53,35.51 29.65,35.51 ; 29.53,35.51 26.84,35.51 26.61,35.28 25.98,35.28 25.68,34.97 25.68,33.8 ; 29.53,35.51 43.18,49.15 v1(43.18,53.75)
  Top Layer w0.254: R12.1 v1(50.54,60.22) 52.94,60.22 CN1.3
  Bottom Layer w0.203: 49.53,60.22 v1(50.54,60.22)
  Bottom Layer w0.254: 49.53,60.22 49.53,60.1 v1(43.18,53.75)
SDA1_GP12: length 45.7
  Top Layer w0.203: 26.48,33.8 26.48,34.14 27.13,34.8 30.07,34.8 44.2,48.92 v1(44.2,52.35)
  Top Layer w0.254: CN3.3 56.68,56.03 52.2,56.03 51.31,56.92 v1(50.49,56.92) R14.1
  Bottom Layer w0.203: 48.77,56.92 v1(50.49,56.92)
  Bottom Layer w0.254: v1(44.2,52.35) 48.77,56.92
SPEPPER_DIR0_GP10: length 31
  Top Layer w0.203: U1.13 28.04,32.45 29.67,34.09 34.95,34.09 39.62,38.76 v1(42.93,38.76)
  Top Layer w0.254: 53.79,42.22 53.79,41.55 53.92,41.41 v1(53.92,41.17)
  Bottom Layer w0.254: 43.05,38.89 51.63,38.89 v1(53.92,41.17)
SPEPPER_DIR1_GP8: length 32.9
  Top Layer w0.203: U1.11 28.32,31.65 30.05,33.38 41.33,33.38 44.58,30.12
  Top Layer w0.254: 53.59,26.82 53.59,26.15 53.73,26.01 v1(53.73,25.77)
  Bottom Layer w0.254: 44.51,30.19 v1(44.61,30.1) 44.7,30 44.7,27.33 45.47,26.57 52.93,26.57 v1(53.73,25.77)
SPEPPER_DIR2_GP6: length 39.7
  Top Layer w0.203: U1.8 38.03,30.45 42.93,25.55 42.93,20.85 v1(43.94,19.84)
  Top Layer w0.254: v1(53.85,9.93) 53.85,10.17 53.74,10.28 U8.19
  Bottom Layer w0.254: 44.2,19.58 45.45,18.33 45.45,16.17 50.8,10.82 52.96,10.82 v1(53.85,9.93)
SPEPPER_EN_GP2: length 91.2
  Top Layer w0.203: v1(44.96,19.84) 44.96,19.33 44.5,18.87 43.76,18.87 43.56,19.08 43.56,19.25 34.8,28.02 34.8,28.47 34.42,28.85 U1.4
  Top Layer w0.254: U8.2 54.24,17.43 v1(54.74,17.93) ; v1(54.86,49.3) 54.86,49.23 54.31,48.68 54.31,47.2 ; v1(47.12,18.06) 48,18.06 48.13,18.19 ; v1(54.61,33.81) 54.61,33.77 54.12,33.28 54.12,31.8
  Bottom Layer w0.203: 43.18,33.93 43.18,22.38 44.96,20.6 v1(44.96,19.84)
  Bottom Layer w0.254: v1(54.86,49.3) 51.05,49.3 41.53,39.78 41.53,38.51 43.18,36.86 43.18,33.93 43.31,33.81 v1(54.61,33.81) ; v1(44.96,19.84) 46.86,17.93 v1(54.74,17.93)
SPEPPER_STEP0_GP11: length 29.1
  Top Layer w0.203: U1.14 27.87,32.85 29.46,34.44 34.67,34.44 39.62,39.4 v1(42.29,39.4)
  Top Layer w0.254: 52.32,42.14 52.32,41.36 v1(52.14,41.17)
  Bottom Layer w0.254: v1(52.14,41.17) 50.36,39.4 42.42,39.4
SPEPPER_STEP1_GP9: length 32.4
  Top Layer w0.203: 44.07,31.27 41.6,33.73 29.82,33.73 28.14,32.05 U1.12
  Top Layer w0.254: U7.16 52.09,25.91 v1(51.95,25.77)
  Bottom Layer w0.254: 44.07,31.39 43.81,31.14 43.81,27.33 45.37,25.77 v1(51.95,25.77)
  vias: v1(44.2,31.39)
SPEPPER_STEP2_GP7: length 39.8
  Top Layer w0.203: U1.9 38.26,30.85 43.43,25.68 43.43,21.23 v1(43.81,20.85)
  Top Layer w0.254: U8.16 52.24,10.35 52.07,10.19 v1(52.07,9.93)
  Bottom Layer w0.254: v1(43.81,20.85) 43.69,20.85 43.18,20.35 43.18,18.82 44.96,17.04 44.96,17.03 44.96,15.9 50.93,9.93 v1(52.07,9.93)
SWC: length 10.5
  Top Layer w0.203: 22.88,33.8 22.88,35.32 22.22,35.97 22.22,41.17 H1.1
SWD: length 14.7
  Top Layer w0.203: 22.48,33.8 22.48,35.21 21.84,35.84 21.84,40.28 20.19,41.94 16.38,41.94 H1.3
UART_RX_GP1: length 17.9
  Top Layer w0.203: U1.3 32.66,28.45 34.29,26.82 34.8,26.82 40.77,20.85 H2.3
UART_TX_GP0: length 16.2
  Top Layer w0.203: H2.2 38.23,22.63 34.8,26.06 34.29,26.06 32.3,28.05 U1.2
USB_DN: length 11.3
  Top Layer w0.254: 21.21,8.53 20.83,8.53 20.46,8.17 USB1.5 ; 21.21,8.53 21.21,16.29 R6.2 ; 21.21,8.53 21.46,8.28 USB1.7
USB_DP: length 12.3
  Top Layer w0.254: R5.2 21.72,16.04 21.72,8.79 21.96,8.55 USB1.8 21.96,6.62 21.72,6.38 21.21,6.38 20.96,6.63 USB1.6
$1N2562: length 3.4
  Top Layer w0.254: USB1.10 22.96,9.64 R2.2
$1N2575: length 3.4
  Top Layer w0.254: R1.2 19.96,9.78 USB1.4
$1N3573: length 4.4
  Top Layer w0.203: SW1.2 31.5,16.7 R4.1
$1N3808: length 15.7
  Top Layer w0.203: X1.1 29.46,41.94 27.81,40.28 27.81,36.6 27.43,36.22 26.54,36.22 26.31,35.99 25.3,35.99 24.48,35.17 24.48,33.8
  Top Layer w0.254: X1.1 30.38,45.33 C10.2
$1N3926: length 9
  Top Layer w0.203: R5.1 22.35,18.81 22.1,19.07 22.1,23.65 22.88,24.43 U1.47
$1N3985: length 9.2
  Top Layer w0.203: U1.46 22.48,24.53 21.72,23.77 21.72,19.58 20.96,18.82 20.96,18.3 R6.1
$1N4134: length 2.7
  Top Layer w0.203: 12.7,28.38 13.43,29.11 R7.2
$1N4138: length 4.1
  Top Layer w0.203: R7.1 17.4,29.11 18.15,29.85 18.69,29.85 18.89,29.65 U1.37
$1N4190: length 5
  Top Layer w0.203: R8.2 26.03,36.35 25.15,36.35 24.08,35.27 24.08,33.8
$1N4191: length 7.3
  Top Layer w0.203: X1.2 26.8,40.64 R8.1
  Top Layer w0.254: C40.2 25.5,45.28 X1.2
$1N4368: length 75.3
  Top Layer w0.203: 22.08,33.8 22.08,35.1 21.46,35.71 21.46,39.78 19.66,41.58 14.71,41.58 13.84,42.44 ; 13.84,42.44 13.27,41.87 C14.2 ; 13.84,42.44 13.84,44.22 14.61,44.98 20.57,44.98 22.35,46.76 31.37,46.76 34.04,44.09 v1(34.04,42.32) ; v1(34.04,28.09) 34.1,28.09 42.86,19.33 42.86,16.66 42.87,16.65 SW2.2
  Bottom Layer w0.254: v1(34.04,28.09) v1(34.04,42.32)
$1N5423: length 12.6
  Top Layer w0.254: CN2.3 21.63,63.74 23.37,62 30.1,62 30.89,61.21 D1.2
$1N5501: length 2.1
  Top Layer w0.254: LED2.1 31.46,56.19 R9.2
$1N6132: length 6.2
  Top Layer w0.254: CN4.3 35.59,61.98 D2.2
$1N6134: length 2.1
  Top Layer w0.254: LED3.1 36.29,56.37 R10.2
$1N6333: length 5.8
  Top Layer w0.254: D3.2 40.41,63.13 CN5.3
$1N6335: length 2.1
  Top Layer w0.254: LED4.1 41.11,56.19 R11.2
$1N7156: length 1.8
  Top Layer w0.203: R16.2 17.78,35.72 U5.7
$1N7164: length 9
  Top Layer w0.254: U5.3 7.99,34.45 6.73,35.71 6.73,40.04 R17.1
$1N7578: length 4.2
  Top Layer w0.254: 59.65,42.83 58.78,43.7 55.81,43.7
$1N7584: length 4.2
  Top Layer w0.254: 55.81,45.7 58.84,45.7 59.65,46.51
$1N7659: length 6.2
  Top Layer w0.254: 50.81,43.7 48.7,43.7 47.19,42.19 47.19,40.28
$1N8001: length 13
  Top Layer w0.254: 55.81,45.2 59.17,45.2
  Top Layer w0.635: 57.08,45.1 65.62,45.1 66.37,45.85
$1N8005: length 13
  Top Layer w0.254: 55.81,44.2 59.1,44.2
  Top Layer w0.635: 66.37,43.35 65.42,44.3 57.06,44.3
$1N8055: length 12.5
  Top Layer w0.254: 54.98,42.03 54.81,42.2
  Top Layer w0.635: 66.37,40.85 66.05,40.54 56.21,40.54 55.69,41.05 55.69,41.32 54.98,42.03
$1N8060: length 13
  Top Layer w0.254: 54.81,47.2 54.81,47.91 55,48.1
  Top Layer w0.635: 66.37,48.35 65.67,49.05 55.95,49.05 55,48.1
$1N8394: length 3.7
  Top Layer w0.254: 50.81,46.2 50.81,48.16 49.86,49.11 49.86,49.49
$1N8530: length 4.8
  Top Layer w0.254: 48.71,40.28 48.71,42.83 49.09,43.2 50.81,43.2
$1N8575: length 7.7
  Top Layer w0.254: 50.81,44.2 48.06,44.2 45.67,41.81 45.67,40.28
$1N8768: length 4
  Top Layer w0.254: 50.81,45.2 49.9,45.2 48.59,46.51 47.31,46.51
$1N8771: length 3.6
  Top Layer w0.254: 50.81,44.7 49,44.7 48.71,44.98 47.31,44.98
$1N8774: length 5.3
  Top Layer w0.254: 47.31,48.03 49.22,48.03 49.73,47.52 49.73,46.1 50.13,45.7 50.81,45.7
$1N8956: length 2.6
  Top Layer w0.254: 51.63,49.49 51.63,48.58 52.28,47.94 52.28,47.19
$1N9009: length 2.4
  Top Layer w0.254: 53.53,49.52 53.53,48.78 53.28,48.52 53.28,47.19
$1N9012: length 4.2
  Top Layer w0.254: 53.41,50.89 53.22,50.89 52.65,50.32 52.65,48.38 52.78,48.25 52.78,47.19
$1N9237: length 3.4
  Top Layer w0.254: U6.17 52.82,40.29 52.83,40.28 ; R31.1 52.83,40.28 ; 52.83,40.28 R30.2
$1N16840: length 4.2
  Top Layer w0.254: 55.62,28.3 58.58,28.3 59.46,27.43
$1N16841: length 4.2
  Top Layer w0.254: 59.46,31.11 58.65,30.3 55.62,30.3
$1N16842: length 6.2
  Top Layer w0.254: 47,24.88 47,26.79 48.51,28.3 50.62,28.3
$1N16845: length 13
  Top Layer w0.254: 55.62,29.8 58.98,29.8
  Top Layer w0.635: 56.89,29.7 65.42,29.7 66.17,30.45
$1N16846: length 13
  Top Layer w0.254: 55.62,28.8 58.91,28.8
  Top Layer w0.635: 56.87,28.9 65.23,28.9 66.17,27.95
$1N16847: length 12.5
  Top Layer w0.254: 54.79,26.63 54.62,26.8
  Top Layer w0.635: 66.17,25.45 65.86,25.14 56.01,25.14 55.5,25.66 55.5,25.92 54.79,26.63
$1N16848: length 13
  Top Layer w0.254: 54.62,31.8 54.62,32.51 54.81,32.7
  Top Layer w0.635: 54.81,32.7 55.76,33.65 65.48,33.65 66.17,32.95
$1N16854: length 3.7
  Top Layer w0.254: 49.66,34.09 49.66,33.71 50.62,32.76 50.62,30.8
$1N16857: length 4.8
  Top Layer w0.254: 50.62,27.8 48.89,27.8 48.52,27.43 48.52,24.88
$1N16858: length 7.7
  Top Layer w0.254: 50.62,28.8 47.86,28.8 45.47,26.41 45.47,24.88
$1N16860: length 4
  Top Layer w0.254: 50.62,29.8 49.7,29.8 48.39,31.11 47.11,31.11
$1N16861: length 3.6
  Top Layer w0.254: 47.11,29.58 48.52,29.58 48.8,29.3 50.62,29.3
$1N16862: length 5.3
  Top Layer w0.254: 47.11,32.63 49.03,32.63 49.54,32.12 49.54,30.7 49.94,30.3 50.62,30.3
$1N16864: length 2.6
  Top Layer w0.254: U7.6 52.09,32.54 51.44,33.18 51.44,34.09
$1N16865: length 2.4
  Top Layer w0.254: U7.4 53.09,33.12 53.34,33.38 C28.1
$1N16866: length 4.2
  Top Layer w0.254: U7.5 52.59,32.85 52.46,32.98 52.46,34.92 53.03,35.49 53.22,35.49
$1N16871: length 3.5
  Top Layer w0.254: 52.62,24.88 52.62,24.89 52.62,26.8 ; 52.62,24.88 53.35,24.88 ; 52.62,24.88 51.82,24.88
$1N17771: length 5.5
  Top Layer w0.254: U8.23 58.71,12.46 R43.1
  Top Layer w0.635: 58.55,12.22 59.18,11.58 R43.1
$1N17772: length 5.3
  Top Layer w0.254: R42.1 58.77,14.46 U8.27
  Top Layer w0.635: 58.55,14.76 58.96,15.17 59.48,15.17
$1N17773: length 6.2
  Top Layer w0.254: R44.2 47.12,10.95 48.63,12.46 U8.13
$1N17776: length 13
  Top Layer w0.254: U8.26 59.1,13.96
  Top Layer w0.635: 57.01,13.86 65.54,13.86 CN10.2
$1N17777: length 13
  Top Layer w0.254: U8.24 59.03,12.96
  Top Layer w0.635: 56.99,13.05 65.35,13.05 CN10.3
$1N17778: length 12.5
  Top Layer w0.254: 54.91,10.79 U8.21
  Top Layer w0.635: CN10.4 65.98,9.3 56.13,9.3 55.62,9.81 55.62,10.08 54.91,10.79
$1N17779: length 13
  Top Layer w0.254: 54.93,16.86 54.74,16.66 U8.1
  Top Layer w0.635: 54.93,16.86 55.88,17.81 65.6,17.81 CN10.1
$1N17785: length 3.7
  Top Layer w0.254: U8.8 50.74,16.91 49.78,17.87 C32.1
$1N17788: length 4.8
  Top Layer w0.254: U8.14 49.01,11.96 48.64,11.58 R46.1
$1N17789: length 7.7
  Top Layer w0.254: R45.1 45.59,10.57 47.98,12.96 U8.12
$1N17791: length 4
  Top Layer w0.254: 47.24,15.27 48.51,15.27 49.82,13.96 U8.10
$1N17792: length 3.6
  Top Layer w0.254: 47.24,13.74 48.64,13.74 48.93,13.46 50.74,13.46
$1N17793: length 5.3
  Top Layer w0.254: 47.24,16.79 49.15,16.79 49.66,16.28 49.66,14.86 50.06,14.46 U8.9
$1N17795: length 2.6
  Top Layer w0.254: C33.1 51.56,17.34 52.24,16.67 U8.6
$1N17796: length 2
  Top Layer w0.254: 53.24,18.15 C34.1 ; U8.4 53.24,17.76
$1N17797: length 4.2
  Top Layer w0.254: C34.2 53.15,19.65 52.58,19.08 52.58,17.13 52.74,16.97 U8.5
$1N17802: length 3.5
  Top Layer w0.254: U8.17 52.74,9.04 52.75,9.03 ; R51.1 52.75,9.03 ; 52.75,9.03 53.47,9.03
$1N19773: length 2.7
  Top Layer w0.254: 12.45,15.02 12.32,14.88 ; 12.45,15.02 R54.2 ; 12.45,15.02 11.96,15.02 11.34,15.63 U9.9
$1N19809: length 8.3
  Top Layer w0.254: U9.8 11.56,14.63 12.19,14 13.59,14 13.84,14.25 13.84,17.93 13.59,18.19 13.07,18.19 R53.2
$1N19847: length 6.4
  Top Layer w0.254: U9.1 4.76,16.77 C39.2 4.83,18.38 4.83,19.08 4.95,19.2 7.49,19.2 8.14,18.56 R52.1
$1N21001: length 11.7
  Top Layer w0.635: 29.39,52.31 U12.4 ; C46.2 27.49,59.9 26.42,58.83 U12.2
  Top Layer w1.016: U12.2 U12.4
$1N29145: length 6.4
  Top Layer w0.635: D5.2 23.94,60.48 C45.2 24.12,60.55 U12.3 23.65,58.45 D4.2

## Copper pours and planes (outline as drawn; the poured copper is in the pictures)
GND on Top Layer: -0.25,69.88 69.85,69.88 69.85,0.03 -0.25,0.03
GND on Bottom Layer: -0.51,70.26 69.85,70.26 69.85,0.03 -0.51,0.03

Small or netless copper shapes (teardrops, artwork), in the pictures only: 569 on Top Layer, 123 on Bottom Layer

## Text on the board
Top Silkscreen Layer: SWD GND SWC | BOOT | GND TXD RXD | RST | 12-20V | gitee.com/hemn1990/rubiks-cube-robot | - | + | POWER | DEBUG | HALL0 | HALL1 | HALL2 | FAN | I2C0 | I2C1 | STEP2 | STEP0 | STEP1
